# Altium schematic sheet Main.SchDoc
size A4; SheetNumber: 1; SheetTotal: 6
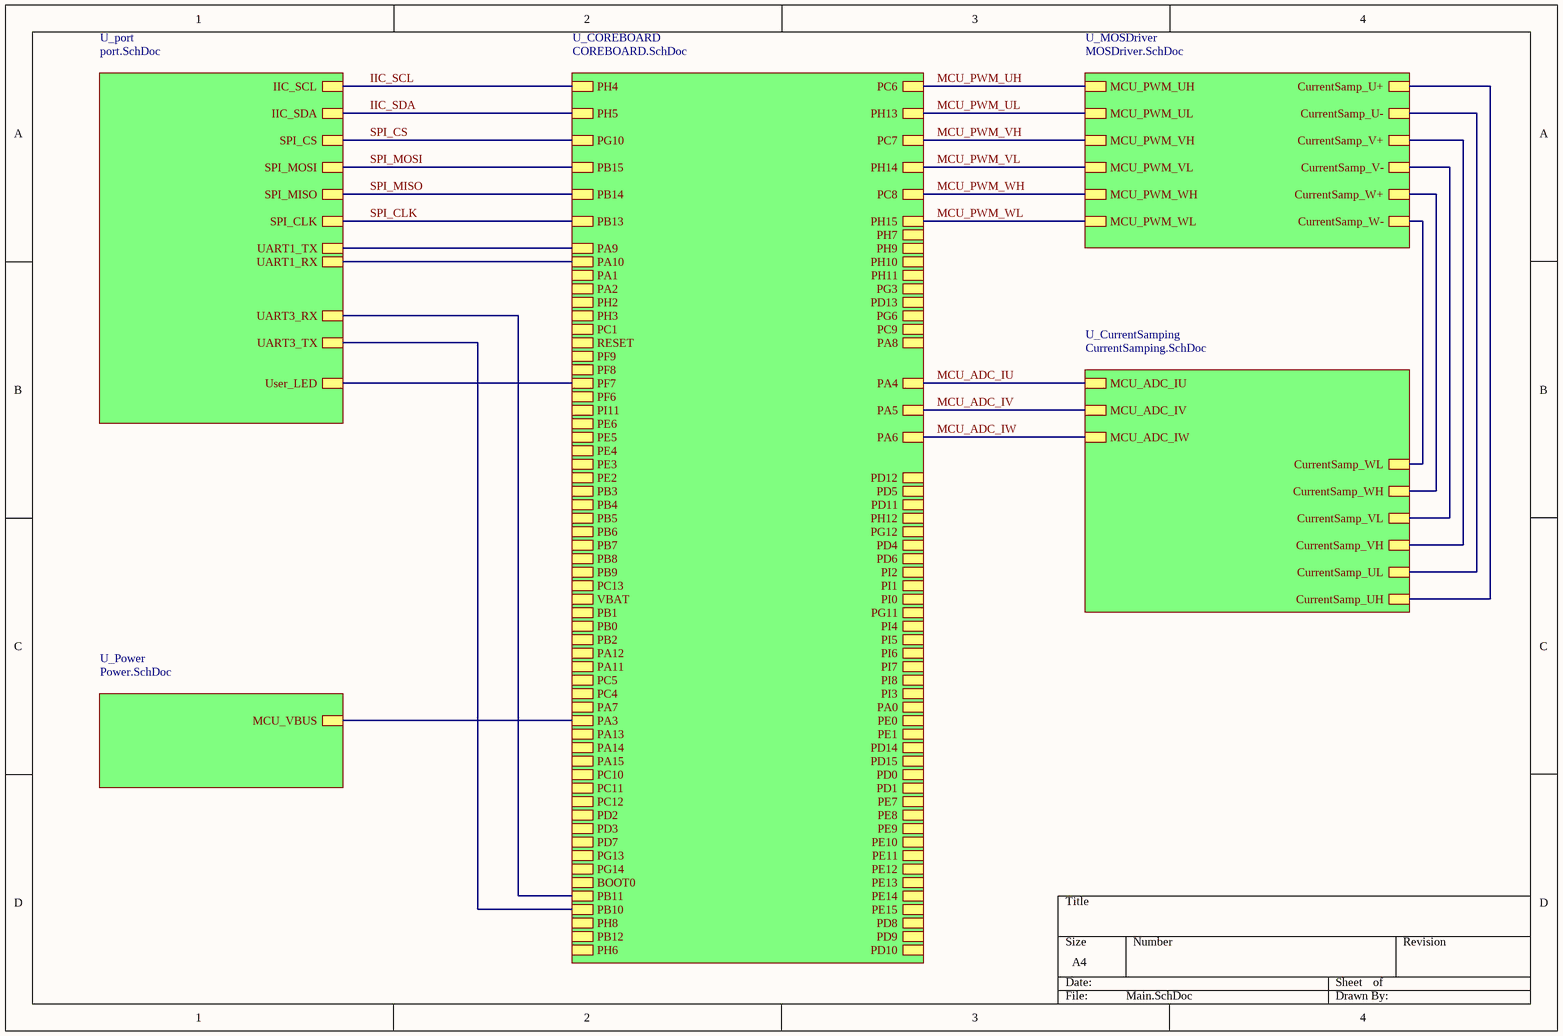
[diagram p0: Main.SchDoc]

## Sub-sheets
U_COREBOARD = COREBOARD.SchDoc: PA1, PA2, PH2, PH3, PH5, PH4, PC1, RESET, PF9, PF8, PF7, PF6, PI11, PE6, PE5, PE4, PE3, PE2, PB3, PB4, PB5, PB6, PB7, PB8, PB9, PC13, VBAT, PB1, PB0, PB2, PA12, PA11, PA10, PA9, PC5, PC4, PA7, PA6, PA5, PA4, PA3, PA13, PA14, PA15, PC10, PC11, PC12, PD2, PD3, PD7, PG10, PG13, PG14, BOOT0, PB11, PB10, PH8, PB12, PB13, PB14, PB15, PH6, PH7, PH9, PH10, PH11, PG3, PD13, PG6, PC6, PC7, PC8, PC9, PA8, PD12, PD5, PD11, PH12, PG12, PD4, PD6, PH15, PH14, PH13, PI2, PI1, PI0, PG11, PI4, PI5, PI6, PI7, PI8, PI3, PA0, PE0, PE1, PD14, PD15, PD0, PD1, PE7, PE8, PE9, PE10, PE11, PE12, PE13, PE14, PE15, PD8, PD9, PD10
U_CurrentSamping = CurrentSamping.SchDoc: CurrentSamp_UL, CurrentSamp_UH, MCU_ADC_IU, CurrentSamp_VL, CurrentSamp_VH, MCU_ADC_IV, CurrentSamp_WL, CurrentSamp_WH, MCU_ADC_IW
U_MOSDriver = MOSDriver.SchDoc: MCU_PWM_UH, MCU_PWM_VH, MCU_PWM_WH, MCU_PWM_UL, MCU_PWM_VL, MCU_PWM_WL, CurrentSamp_U+, CurrentSamp_U-, CurrentSamp_V+, CurrentSamp_V-, CurrentSamp_W+, CurrentSamp_W-
U_port = port.SchDoc: IIC_SCL, IIC_SDA, SPI_CS, SPI_MOSI, SPI_MISO, SPI_CLK, User_LED, UART1_RX, UART1_TX, UART3_RX, UART3_TX
U_Power = Power.SchDoc: MCU_VBUS

## Nets
IIC_SCL: sheet U_port/IIC_SCL, sheet U_COREBOARD/PH4
IIC_SDA: sheet U_port/IIC_SDA, sheet U_COREBOARD/PH5
MCU_ADC_IU: sheet U_CurrentSamping/MCU_ADC_IU, sheet U_COREBOARD/PA4
MCU_ADC_IV: sheet U_CurrentSamping/MCU_ADC_IV, sheet U_COREBOARD/PA5
MCU_ADC_IW: sheet U_CurrentSamping/MCU_ADC_IW, sheet U_COREBOARD/PA6
MCU_PWM_UH: sheet U_MOSDriver/MCU_PWM_UH, sheet U_COREBOARD/PC6
MCU_PWM_UL: sheet U_MOSDriver/MCU_PWM_UL, sheet U_COREBOARD/PH13
MCU_PWM_VH: sheet U_MOSDriver/MCU_PWM_VH, sheet U_COREBOARD/PC7
MCU_PWM_VL: sheet U_MOSDriver/MCU_PWM_VL, sheet U_COREBOARD/PH14
MCU_PWM_WH: sheet U_MOSDriver/MCU_PWM_WH, sheet U_COREBOARD/PC8
MCU_PWM_WL: sheet U_MOSDriver/MCU_PWM_WL, sheet U_COREBOARD/PH15
SPI_CLK: sheet U_port/SPI_CLK, sheet U_COREBOARD/PB13
SPI_CS: sheet U_port/SPI_CS, sheet U_COREBOARD/PG10
SPI_MISO: sheet U_port/SPI_MISO, sheet U_COREBOARD/PB14
SPI_MOSI: sheet U_port/SPI_MOSI, sheet U_COREBOARD/PB15
(unnamed): sheet U_CurrentSamping/CurrentSamp_UL, sheet U_MOSDriver/CurrentSamp_U-
(unnamed): sheet U_CurrentSamping/CurrentSamp_UH, sheet U_MOSDriver/CurrentSamp_U+
(unnamed): sheet U_CurrentSamping/CurrentSamp_VL, sheet U_MOSDriver/CurrentSamp_V-
(unnamed): sheet U_CurrentSamping/CurrentSamp_VH, sheet U_MOSDriver/CurrentSamp_V+
(unnamed): sheet U_CurrentSamping/CurrentSamp_WL, sheet U_MOSDriver/CurrentSamp_W-
(unnamed): sheet U_CurrentSamping/CurrentSamp_WH, sheet U_MOSDriver/CurrentSamp_W+
(unnamed): sheet U_port/User_LED, sheet U_COREBOARD/PF7
(unnamed): sheet U_port/UART1_RX, sheet U_COREBOARD/PA10
(unnamed): sheet U_port/UART1_TX, sheet U_COREBOARD/PA9
(unnamed): sheet U_port/UART3_RX, sheet U_COREBOARD/PB11
(unnamed): sheet U_port/UART3_TX, sheet U_COREBOARD/PB10
(unnamed): sheet U_COREBOARD/PA3, sheet U_Power/MCU_VBUS